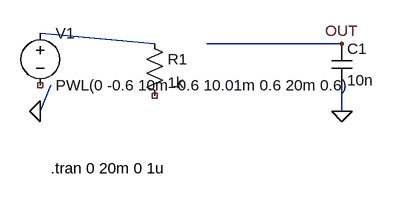
[diagram p0: schematic tst.asc]
tst.asc, the LTspice schematic file:
Version 4
SHEET 1 880 680
WIRE 48 192 224 208
WIRE 64 272 48 312
WIRE 304 208 512 208
WIRE 512 272 512 312
SYMBOL voltage 48 176 R0
SYMATTR InstName V1
SYMATTR Value PWL(0 -0.6 10m -0.6 10.01m 0.6 20m 0.6)
SYMBOL res 208 192 R0
SYMATTR InstName R1
SYMATTR Value 1k
SYMBOL cap 496 208 R0
SYMATTR InstName C1
SYMATTR Value 10n
FLAG 48 312 0
FLAG 512 312 0
FLAG 512 208 OUT
TEXT 64 400 Left 2 !.tran 0 20m 0 1u

The netlist it stands for:
* tst.asc
V1 N001 NC_01 PWL(0 -0.6 10m -0.6 10.01m 0.6 20m 0.6)
R1 N001 NC_02 1k
C1 OUT 0 10n
.tran 0 20m 0 1u
.backanno
.end